# Altium schematic sheet SMPS300W-1.schdoc
size 307 x 309 mm
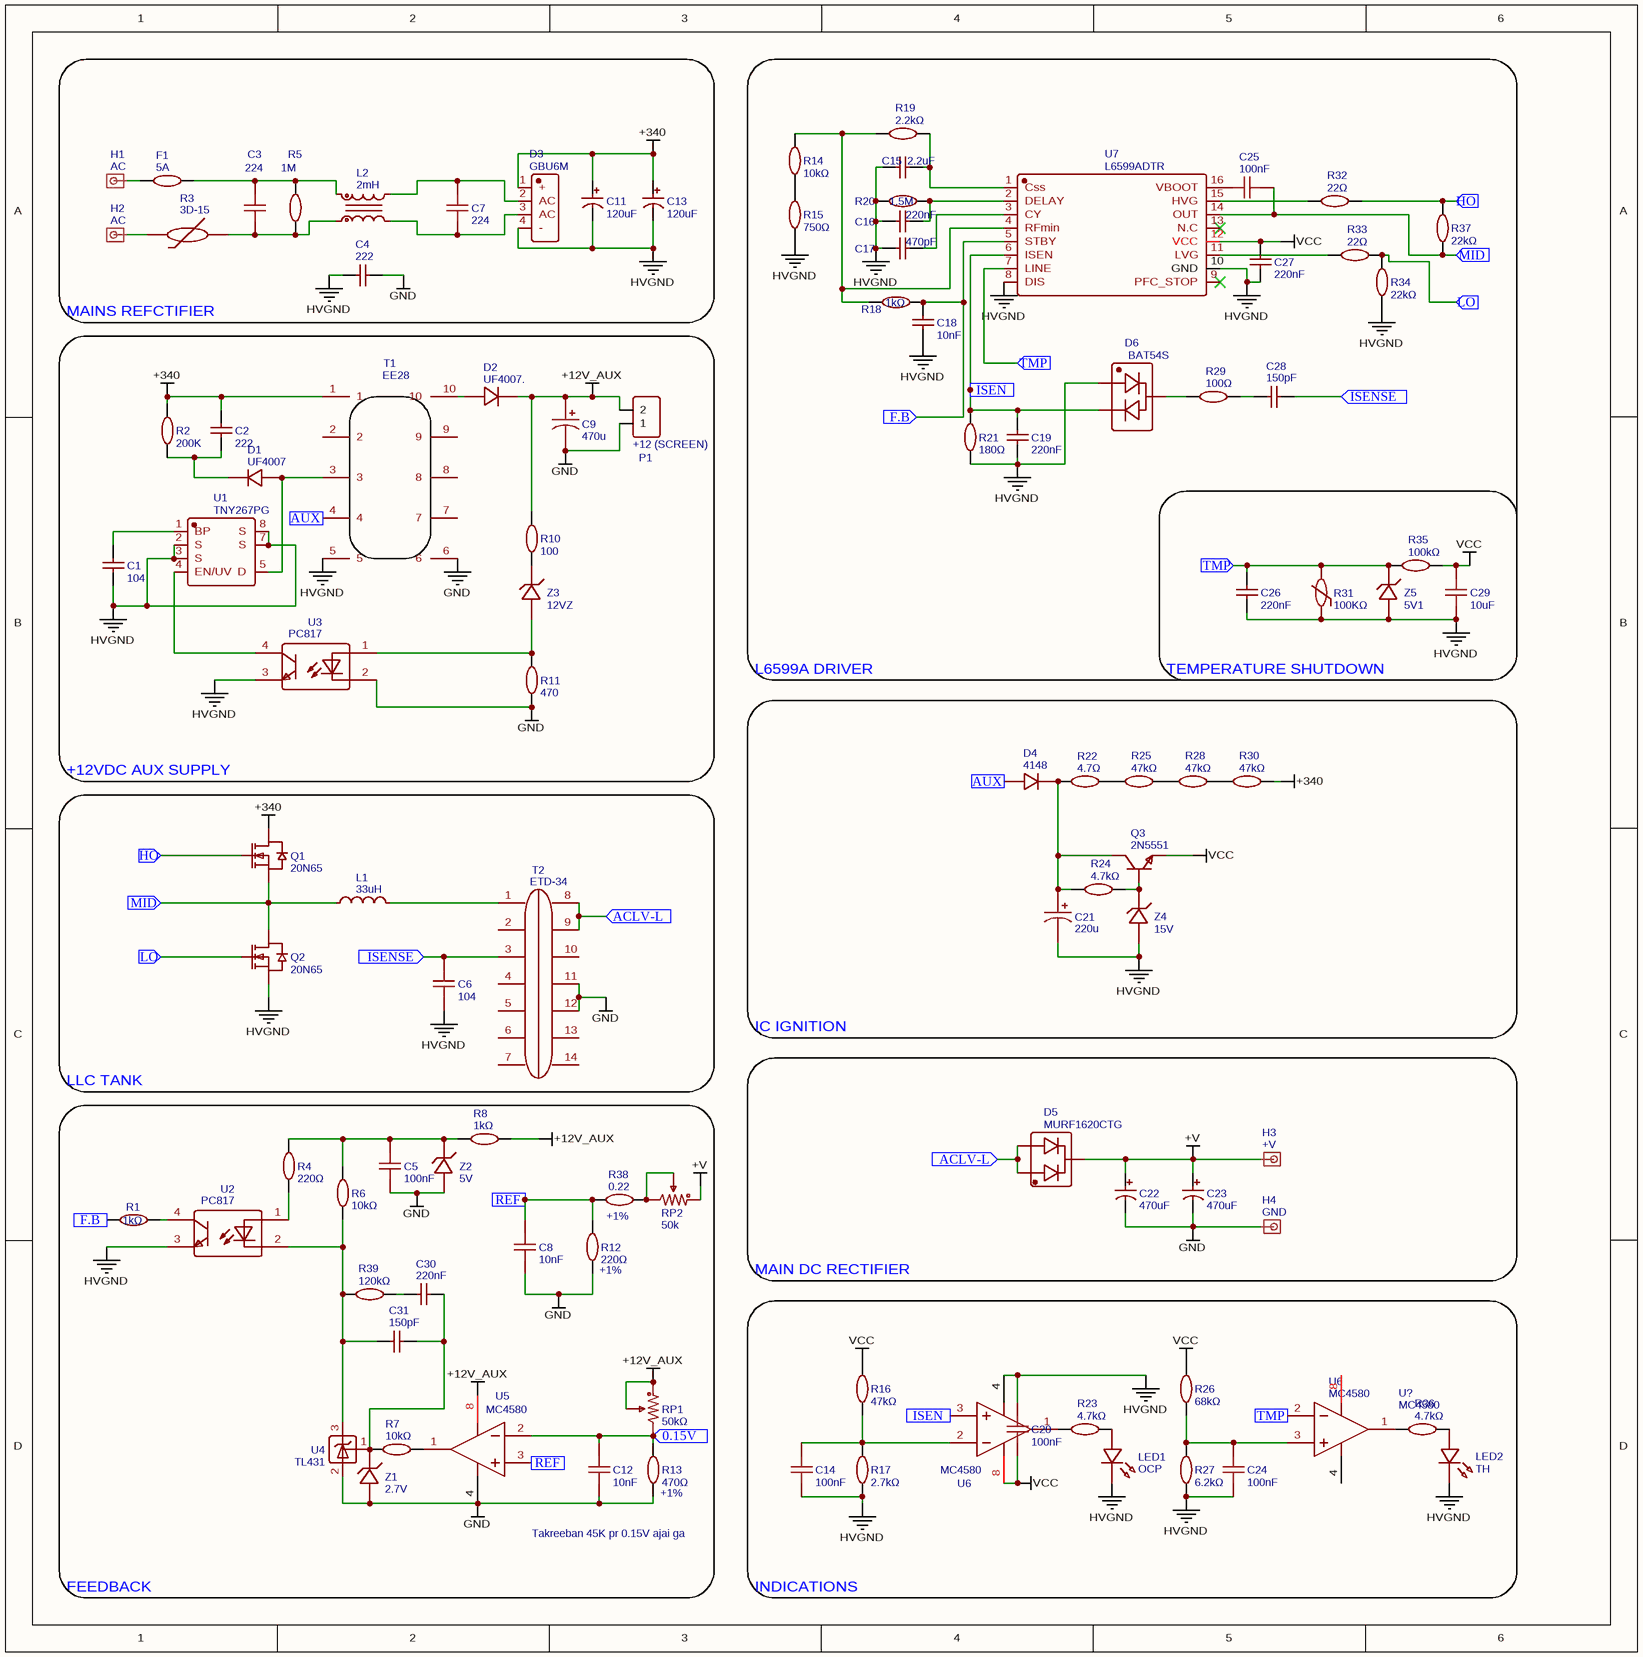
[diagram p0: SMPS300W-1.schdoc]

## Parts
(Parts that share a designator on the sheet are numbered #1, #2 ... from top to bottom, then left to right.)
C1  104  [CAP 2SILKG]
C2  222  [CAP 2SILKG]
C3  224  [CAP-TH_L18.0-W7.0-P15.00-D0.7]
C4  222  [CAP 2SILKG]
C5  100nF  [C0603]
C6  104  [CAP-TH_L17.5-W10.0-P15.00-D1.2]
C7  224  [CAP-TH_L18.0-W7.0-P15.00-D0.7]
C8  10nF  [C0603]
C9  470u  [CAP-D8.0×F3.5]
C11  120uF  [CAP-TH_BD18.0-P7.50-D1.2-FD]
C12  10nF  [C0603]
C13  120uF  [CAP-TH_BD18.0-P7.50-D1.2-FD]
C14  100nF  [C0603]
C15  2.2uF  [C0603]
C16  220nF  [C0603]
C17  470pF  [C0603]
C18  10nF  [C0603]
C19  220nF  [C0603]
C20  100nF  [C0603]
C21  220u  [C_HOR]
C22  470uF  [CAP-TH_BD16.0-P7.50-D1.2-FD]
C23  470uF  [CAP-TH_BD16.0-P7.50-D1.2-FD]
C24  100nF  [C0603]
C25  100nF  [C0603]
C26  220nF  [C0603]
C27  220nF  [C0603]
C28  150pF  [C0805]
C29  10uF  [C0805]
C30  220nF  [C0603]
C31  150pF  [C0603]
D1  UF4007  [DIODE 2SILK]
D2  UF4007.  [DO-15_BD3.1-L6.7-P10.70-D0.9-FD]
D3  GBU6M  [DIO-BG-TH_GBU]
D4  4148  [DIODE 2SILK]
D5  MURF1620CTG  [TO-220AB-3_L10.4-W4.6-P2.54-T]
D6  BAT54S  [SOT-23-3_L2.9-W1.4-P1.91-LS2.6-BR]
F1  5A  [RES 2W VERTICAL]
H1  AC  [LUGS]
H2  AC  [LUGS]
H3  +V  [LUGS]
H4  GND  [LUGS]
L1  33uH  [33UH_SMALL]
L2  2mH  [IND-TH_4P-L20.0-W12.0-P7.00]
LED1  OCP  [LED-TH_BD3.0_RED]
LED2  TH  [LED-TH_BD3.0_BLUE]
P1  +12 (SCREEN)  [CONN-TH_2P-P5.00]
Q1  20N65  [TO-220-3_L10.0-W4.5-P2.54-L]
Q2  20N65  [TO-220-3_L10.0-W4.5-P2.54-L]
Q3  2N5551  [TO-92-3_L4.8-W3.7-P2.54-L]
R1  1kΩ  [R0603]
R2  200K  [1/4W 2SILK]
R3  3D-15  [RES-TH_L17.0-W5.5-P7.50-D1.2]
R4  220Ω  [R0603]
R5  1M  [1/4W 2SILK]
R6  10kΩ  [R0603]
R7  10kΩ  [R0603]
R8  1kΩ  [1/4W 2SILK]
R10  100  [1/4W 2SILK]
R11  470  [1/4W 2SILK]
R12  220Ω  [R0603]
R13  470Ω  [R0603]
R14  10kΩ  [R0603]
R15  750Ω  [R0603]
R16  47kΩ  [R0603]
R17  2.7kΩ  [R0603]
R18  1kΩ  [R0603]
R19  2.2kΩ  [R0603]
R20  1.5M  [R0603]
R21  180Ω  [R0603]
R22  4.7Ω  [R0603]
R23  4.7kΩ  [R0603]
R24  4.7kΩ  [R0603]
R25  47kΩ  [R0805]
R26  68kΩ  [R0603]
R27  6.2kΩ  [R0603]
R28  47kΩ  [R0805]
R29  100Ω  [R0805]
R30  47kΩ  [R0805]
R31  100KΩ  [RES-TH_L7.0-W4.0-P2.50-D1.0-S2.00]
R32  22Ω  [R0603]
R33  22Ω  [R0603]
R34  22kΩ  [R0603]
R35  100kΩ  [R0603]
R36  4.7kΩ  [R0603]
R37  22kΩ  [R0603]
R38  0.22  [R0603]
R39  120kΩ  [R0603]
RP1  50kΩ  [RES-ADJ-TH_3386P]
RP2  50k  [RES-ADJ-TH_3386P]
T1  EE28  [EE28]
T2  ETD-34  [ETD-34]
U1  TNY267PG  [DIP-8B_7P-L9.6-W6.4-P2.54-LS7.6-BL-PE6]
U2  PC817  [DIP-4_L4.6-W6.5-P2.54-LS7.6-BL]
U3  PC817  [DIP-4_L4.6-W6.5-P2.54-LS7.6-BL]
U4  TL431  [TO-92-3_L4.9-W3.7-P2.54-L-A]
U5  MC4580  [SOP-8_L4.9-W3.9-P1.27-LS6.0-BL]
U6#1  MC4580  [SOP-8_L4.9-W3.9-P1.27-LS6.0-BL]
U6#2  MC4580  [SOP-8_L4.9-W3.9-P1.27-LS6.0-BL]
U7  L6599ADTR  [SOIC-16_L9.9-W3.9-P1.27-LS6.0-BL]
U?  MC4580  [SOP-8_L4.9-W3.9-P1.27-LS6.0-BL]
Z1  2.7V  [DIODE 2SILK]
Z2  5V  [DIODE 2SILK]
Z3  12VZ  [DIODE 2SILK]
Z4  15V  [DIODE 2SILK]
Z5  5V1  [DIODE 2SILK]

## Blocks framed on the sheet
MAINS REFCTIFIER: C3 C4 C7 C11 C13 D3 F1 H1 H2 L2 R3 R5
L6599A DRIVER: C15-C19 C25 C27 C28 D6 R14 R15 R18-R21 R29 R32-R34 R37 U7
+12VDC AUX SUPPLY: C1 C2 C9 D1 D2 P1 R2 R10 R11 T1 U1 U3 Z3
TEMPERATURE SHUTDOWN: C26 C29 R31 R35 Z5
IC IGNITION: C21 D4 Q3 R22 R24 R25 R28 R30 Z4
MAIN DC RECTIFIER: C22 C23 D5 H3 H4
INDICATIONS: C14 C20 C24 LED1 LED2 R16 R17 R23 R26 R27 R36 U6#1 U6#2 U?

## Ports
0.15V (in), ACLV-L (in), AUX (in), F.B (in), HO (in), ISEN (in), ISENSE (in), LO (in), MID (in), REF (in), TMP (in)

## Nets
+12V_AUX: C9.1 D2.2(K) P1.2 R8.1 R10.1 RP1.1 RP1.2 U5.8(V+)
+340: C2.1 C11.1 C13.1 D3.1(+) Q1.2(D) R2.1 R30.2 T1.1
+V: C22.1 C23.1 D5.2 H3.1 RP2.1
GND: C4.2 C5.1 C8.1 C9.2 C12.1 C22.2 C23.2 H4.1 P1.1 R11.2 R12.1 R13.1 T1.6 T2.11 T2.12 U3.2(CAT) U4.2(A) U5.4(V-) Z1.1(A) Z2.1(A)
HVGND: C1.2 C4.1 C6.2 C11.2 C13.2 C14.1 C15.1 C16.1 C17.1 C18.1 C19.1 C20.2 C21.2 C24.1 C26.1 C27.1 C29.1 D3.4(-) D6.1 LED1.2 LED2.2 Q2.3(S) R15.1 R17.1 R20.1 R21.1 R27.1 R31.1 R34.1 T1.5 U1.2(S) U1.3(S) U1.7(S) U1.8(S) U2.3(EM) U3.3(EM) U6#1.4(V-) U7.8(DIS) U7.10(GND) Z4.1(A) Z5.1(A)
VCC: C20.1 C27.2 C29.2 Q3.1(E) R16.2 R26.2 R35.2 U6#1.8(V+) U7.12(VCC)
0.15V: C12.2 R13.2 RP1.3 U5.2(IN_A-) ; port 0.15V
ACLV-L: D5.1 D5.3 T2.8 T2.9 ; port ACLV-L
AUX: D4.1(A) T1.4 ; port AUX
F.B: C18.2 R1.1 R18.2 U7.5(STBY) ; port F.B
HO: Q1.1(G) R32.2 R37.2 ; port HO
ISEN: C19.2 D6.2 R21.2 U6#1.3(IN_A+) U7.6(ISEN) ; port ISEN
ISENSE: C6.1 C28.2 T2.3 ; port ISENSE
LO: Q2.1(G) R33.2 R34.2 ; port LO
MID: C25.2 L1.1 Q1.3(S) Q2.2(D) R37.1 U7.14(OUT) ; port MID
REF: C8.2 R12.2 R38.2 U5.3(IN_A+) ; port REF
TMP: C26.2 R31.2 R35.1 U7.7(LINE) U?.2(IN_A-) Z5.2(K) ; port TMP
NetC1_1: C1.1 U1.1(BP)
NetC2_2: C2.2 D1.2(K) R2.2
NetC3_1: C3.1 L2.1 R3.2 R5.1
NetC3_2: C3.2 F1.1 L2.4 R5.2
NetC5_2: C5.2 R4.2 R6.2 R8.2 Z2.2(K)
NetC7_1: C7.1 D3.3(AC) L2.2
NetC7_2: C7.2 D3.2(AC) L2.3
NetC14_2: C14.2 R16.1 R17.2 U6#1.2(IN_A-)
NetC15_2: C15.2 R19.2 U7.1(Css)
NetC16_2: C16.2 R20.2 U7.2(DELAY)
NetC17_2: C17.2 U7.3(CY)
NetC21_1: C21.1 D4.2(K) Q3.3(C) R22.1 R24.1
NetC24_2: C24.2 R26.1 R27.2 U?.3(IN_A+)
NetC25_1: C25.1 U7.16(VBOOT)
NetC28_1: C28.1 R29.2
NetC30_1: C30.1 R39.1
NetC30_2: C30.2 C31.2 R7.2 U4.1(R) Z1.2(K)
NetC31_1: C31.1 R6.1 R39.2 U2.2(CAT) U4.3(K)
NetD1_1: D1.1(A) T1.3 U1.5(D)
NetD2_1: D2.1(A) T1.10
NetD6_3: D6.3 R29.1
NetF1_2: F1.2 H1.1
NetH2_1: H2.1 R3.1
NetL1_2: L1.2 T2.1
NetLED1_1: LED1.1 R23.2
NetLED2_1: LED2.1 R36.2
NetQ3_2: Q3.2(B) R24.2 Z4.2(K)
NetR1_2: R1.2 U2.4(COL)
NetR4_1: R4.1 U2.1(AN)
NetR7_1: R7.1 U5.1(OUT_A)
NetR10_2: R10.2 Z3.2(K)
NetR11_1: R11.1 U3.1(AN) Z3.1(A)
NetR14_1: R14.1 R15.2
NetR14_2: R14.2 R18.1 R19.1 U7.4(RFmin)
NetR22_2: R22.2 R25.1
NetR23_1: R23.1 U6#1.1(OUT_A)
NetR25_2: R25.2 R28.1
NetR28_2: R28.2 R30.1
NetR32_1: R32.1 U7.15(HVG)
NetR33_1: R33.1 U7.11(LVG)
NetR36_1: R36.1 U?.1(OUT_A)
NetR38_1: R38.1 RP2.2 RP2.3
NetU1_4: U1.4(EN/UV) U3.4(COL)

Not connected (* = marked no-connect by the designer): T1 2 7 8 9; T2 2 4 5 6 7 10 13 14; U7 9(PFC_STOP)* 13(N.C)*; U? 4(V-) 8(V+)

## Notes on the sheet
- LLC TANK
- (near R12) +1%
- +1%
- Takreeban 45K pr 0.15V ajai ga
- (near R13) +1%
- FEEDBACK

## Library data of the parts
C1 = 104: Contributor: shaikhabdulmobeen; spicePre: C; spiceSymbolName: 104(GRY)
C2 C4 = 222: Contributor: shaikhabdulmobeen; spicePre: C; spiceSymbolName: 104(GRY)
C3 C7 = 224: BOM_Manufacturer: 东通电子; BOM_Manufacturer Part: MKP62-275VAC/334; nameAlias: Capacitance; Contributor: LCSC; BOM_Supplier: LCSC; BOM_Supplier Part: C2913191; BOM_JLCPCB Part Class: Extended Part; spicePre: C; spiceSymbolName: MKP62-275VAC/334
C5 C14 C20 C24 C25 = 100nF: BOM_Manufacturer: YAGEO(国巨); BOM_Manufacturer Part: CC0603KRX7R9BB104; nameAlias: Capacitance; BOM_Supplier: LCSC; BOM_Supplier Part: C14663; BOM_JLCPCB Part Class: Basic Part; spicePre: C; spiceSymbolName: CC0603KRX7R9BB104
C6 = 104: BOM_Manufacturer: faratronic(厦门法拉); BOM_Manufacturer Part: C822J104J60C000; nameAlias: Capacitance; Contributor: LCSC; BOM_Supplier: LCSC; BOM_Supplier Part: C280299; BOM_JLCPCB Part Class: Extended Part; spicePre: C; spiceSymbolName: C822J104J60C000
C8 C12 = 10nF: BOM_Manufacturer: YAGEO(国巨); BOM_Manufacturer Part: CC0603KRX7R9BB104; nameAlias: Capacitance; BOM_Supplier: LCSC; BOM_Supplier Part: C14663; BOM_JLCPCB Part Class: Basic Part; spicePre: C; spiceSymbolName: CC0603KRX7R9BB104
C9 = 470u: nameAlias: Value(F); Contributor: LCEDA_Lib; spicePre: C; spiceSymbolName: CE_TH_D8.0×F3.5_US
C11 C13 = 120uF: BOM_Manufacturer: CX(承兴); BOM_Manufacturer Part: KM127M400L30RR0VH2FP0; nameAlias: Capacitance; BOM_Supplier: LCSC; BOM_Supplier Part: C46881; BOM_JLCPCB Part Class: Extended Part; spicePre: C; spiceSymbolName: 120uF 400V 18*30
C15 = 2.2uF: BOM_Manufacturer Part: CL10A225KO8NNNC; BOM_Manufacturer: SAMSUNG(三星); nameAlias: Capacitance; BOM_Supplier: LCSC; BOM_Supplier Part: C23630; BOM_JLCPCB Part Class: Basic Part; spicePre: C; spiceSymbolName: CL10A225KO8NNNC
C16 C19 C26 C27 = 220nF: BOM_Manufacturer Part: CL10B224KA8NNNC; BOM_Manufacturer: SAMSUNG(三星); nameAlias: Capacitance; BOM_Supplier: LCSC; BOM_Supplier Part: C21120; BOM_JLCPCB Part Class: Basic Part; spicePre: C; spiceSymbolName: CL10B224KA8NNNC
C17 = 470pF: BOM_Manufacturer: FH(风华); BOM_Manufacturer Part: 0603B471K500NT; nameAlias: Capacitance; BOM_Supplier: LCSC; BOM_Supplier Part: C1620; BOM_JLCPCB Part Class: Basic Part; spicePre: C; spiceSymbolName: 0603B471K500NT
C18 = 10nF: BOM_Manufacturer Part: CL10B333KB8NNNC; BOM_Manufacturer: SAMSUNG(三星); nameAlias: Capacitance; BOM_Supplier: LCSC; BOM_Supplier Part: C21117; BOM_JLCPCB Part Class: Basic Part; spicePre: C; spiceSymbolName: CL10B333KB8NNNC
C21 = 220u: Contributor: shaikhabdulmobeen; spicePre: C; spiceSymbolName: cap horizontal
C22 C23 = 470uF: BOM_Manufacturer: CX(承兴); BOM_Manufacturer Part: KM477M100K25RR0VH2FP0; nameAlias: Capacitance; BOM_Supplier: LCSC; BOM_Supplier Part: C72551; BOM_JLCPCB Part Class: Extended Part; spicePre: C; spiceSymbolName: 470uF 100V 16*25
C28 = 150pF: BOM_Manufacturer: FH(风华); BOM_Manufacturer Part: 0805B151K500NT; nameAlias: Capacitance; BOM_Supplier: LCSC; BOM_Supplier Part: C1716; BOM_JLCPCB Part Class: Basic Part; spicePre: C; spiceSymbolName: 0805B151K500NT
C29 = 10uF: BOM_Manufacturer: muRata(村田); BOM_Manufacturer Part: GRM21BR61H106KE43L; nameAlias: Capacitance; Contributor: LCSC; BOM_Supplier: LCSC; BOM_Supplier Part: C440198; BOM_JLCPCB Part Class: Basic Part; spicePre: C; spiceSymbolName: GRM21BR61H106KE43L
C30 = 220nF: BOM_Manufacturer: FH(风华); BOM_Manufacturer Part: 0603B103K500NT; nameAlias: Capacitance; BOM_Supplier: LCSC; BOM_Supplier Part: C57112; BOM_JLCPCB Part Class: Basic Part; spicePre: C; spiceSymbolName: 0603B103K500NT
C31 = 150pF: BOM_Manufacturer: FH(风华); BOM_Manufacturer Part: 0603B151K500NT; nameAlias: Capacitance; BOM_Supplier: LCSC; BOM_Supplier Part: C1594; BOM_JLCPCB Part Class: Basic Part; spicePre: C; spiceSymbolName: 0603B151K500NT
D1 = UF4007: Contributor: shaikhabdulmobeen; spicePre: D; spiceSymbolName: 4148
D2 = UF4007.: BOM_Manufacturer: GD(固锝); BOM_Manufacturer Part: HER205; Contributor: LCSC; BOM_Supplier: LCSC; BOM_Supplier Part: C232180; BOM_JLCPCB Part Class: Extended Part; spicePre: D; spiceSymbolName: HER205_C232180
D3 = GBU6M: BOM_Manufacturer: PANJIT(强茂); BOM_Manufacturer Part: GBU6M_B0_10001; Contributor: LCSC; BOM_Supplier: LCSC; BOM_Supplier Part: C393434; BOM_JLCPCB Part Class: Extended Part; spicePre: D; spiceSymbolName: GBU6M_B0_10001
D4 = 4148: Contributor: shaikhabdulmobeen; spicePre: D; spiceSymbolName: 4148
D5 = MURF1620CTG: BOM_Manufacturer: Suzhou Good-Ark Elec; BOM_Manufacturer Part: MBRF20150CT; Contributor: LCSC; BOM_Supplier: LCSC; BOM_Supplier Part: C174019; spicePre: D; spiceSymbolName: MBRF20150CT_C174019
D6 = BAT54S: BOM_Manufacturer: CBI(创基); BOM_Manufacturer Part: BAT54S KL4; Contributor: LCSC; BOM_Supplier: LCSC; BOM_Supplier Part: C2828465; BOM_JLCPCB Part Class: Extended Part; spicePre: D; spiceSymbolName: BAT54S KL4_C2828465
F1 = 5A: BOM_Manufacturer: UniOhm; BOM_Manufacturer Part: MFR03SF5601A10; nameAlias: Resistance (Ohms); BOM_Supplier: LCSC; BOM_Supplier Part: C83337; spicePre: R; spiceSymbolName: MFR03SF5601A10
H1 H2 = AC: Contributor: shaikhabdulmobeen; spicePre: H; spiceSymbolName: LUGS
H3 = +V: Contributor: shaikhabdulmobeen; spicePre: H; spiceSymbolName: LUGS
H4 = GND: Contributor: shaikhabdulmobeen; spicePre: H; spiceSymbolName: LUGS
L1 = 33uH: Contributor: shaikhabdulmobeen; Inductance: 15uH; BOM_Supplier: LCSC; spicePre: L; spiceSymbolName: 33uH_Small
L2 = 2mH: BOM_Manufacturer: PROD(谱罗德); BOM_Manufacturer Part: PDMCAT16128-202ML; Contributor: LCSC; BOM_Supplier: LCSC; BOM_Supplier Part: C2829012; BOM_JLCPCB Part Class: Extended Part; spicePre: L; spiceSymbolName: PDMCAT16128-202ML
LED1 = OCP: BOM_Manufacturer: EVERLIGHT(台湾亿光); BOM_Manufacturer Part: 204-10SDRD/S530-A3-L; Contributor: LCEDA_Lib; BOM_Supplier Part: C84774; BOM_Supplier: LCSC; spicePre: L; spiceSymbolName: LED-TH-3mm_R
LED2 = TH: BOM_Manufacturer: EVERLIGHT(台湾亿光); BOM_Manufacturer Part: 204-10SUBC/S400-A4; Contributor: LCEDA_Lib; BOM_Supplier Part: C86881; BOM_Supplier: LCSC; spicePre: L; spiceSymbolName: LED-TH-3mm_B
P1 = +12 (SCREEN): Contributor: LCEDA_Lib; BOM_Supplier: LCSC; spicePre: P; spiceSymbolName: CONN-TH_2P-P5.00
Q1 Q2 = 20N65: BOM_Manufacturer: Infineon(英飞凌); BOM_Manufacturer Part: IRFZ44VZPBF; Contributor: LCSC; BOM_Supplier: LCSC; BOM_Supplier Part: C538077; BOM_JLCPCB Part Class: Extended Part; spicePre: Q; spiceSymbolName: IRFZ44VZPBF
Q3 = 2N5551: BOM_Manufacturer: KEC; BOM_Manufacturer Part: 2N5551-AT/P; Contributor: LCSC; BOM_Supplier: LCSC; BOM_Supplier Part: C220530; BOM_JLCPCB Part Class: Extended Part; spicePre: Q; spiceSymbolName: 2N5551-AT/P
R1 R18 = 1kΩ: BOM_Manufacturer: UNI-ROYAL(厚声); BOM_Manufacturer Part: 0603WAF1001T5E; nameAlias: Resistance; Resistance (Ohms): 1K; BOM_Supplier: LCSC; BOM_Supplier Part: C21190; BOM_JLCPCB Part Class: Basic Part; spicePre: R; spiceSymbolName: 0603WAF1001T5E
R2 = 200K: Contributor: shaikhabdulmobeen; spicePre: R; spiceSymbolName: 1K
R3 = 3D-15: BOM_Manufacturer: RUILON(瑞隆源); BOM_Manufacturer Part: NTC 3D-15; nameAlias: Value; Contributor: LCSC; BOM_Supplier: LCSC; BOM_Supplier Part: C207388; BOM_JLCPCB Part Class: Extended Part; spicePre: R; spiceSymbolName: NTC 3D-15
R4 R12 = 220Ω: BOM_Manufacturer: UNI-ROYAL(厚声); BOM_Manufacturer Part: 0603WAF3001T5E; nameAlias: Resistance; Resistance (Ohms): 3K; BOM_Supplier: LCSC; BOM_Supplier Part: C4211; BOM_JLCPCB Part Class: Basic Part; spicePre: R; spiceSymbolName: 0603WAF3001T5E
R5 = 1M: Contributor: shaikhabdulmobeen; spicePre: R; spiceSymbolName: 1K
R6 R7 R14 = 10kΩ: BOM_Manufacturer: UNI-ROYAL(厚声); BOM_Manufacturer Part: 0603WAF1002T5E; nameAlias: Resistance; Resistance (Ohms): 10K; BOM_Supplier: LCSC; BOM_Supplier Part: C25804; BOM_JLCPCB Part Class: Basic Part; spicePre: R; spiceSymbolName: 0603WAF1002T5E
R8 = 1kΩ: Contributor: shaikhabdulmobeen; spicePre: R; spiceSymbolName: 1K
R10 = 100: Contributor: shaikhabdulmobeen; spicePre: R; spiceSymbolName: 1K
R11 = 470: Contributor: shaikhabdulmobeen; spicePre: R; spiceSymbolName: 1K
R13 = 470Ω: BOM_Manufacturer: UNI-ROYAL(厚声); BOM_Manufacturer Part: 0603WAF1002T5E; nameAlias: Resistance; Resistance (Ohms): 10K; BOM_Supplier: LCSC; BOM_Supplier Part: C25804; BOM_JLCPCB Part Class: Basic Part; spicePre: R; spiceSymbolName: 0603WAF1002T5E
R15 = 750Ω: BOM_Manufacturer: UNI-ROYAL(厚声); BOM_Manufacturer Part: 0603WAF7500T5E; nameAlias: Resistance; Resistance (Ohms): 750; BOM_Supplier: LCSC; BOM_Supplier Part: C23241; BOM_JLCPCB Part Class: Basic Part; spicePre: R; spiceSymbolName: 0603WAF7500T5E
R16 = 47kΩ: BOM_Manufacturer: UNI-ROYAL(厚声); BOM_Manufacturer Part: 0603WAF4702T5E; nameAlias: Resistance; Resistance (Ohms): 47K; BOM_Supplier: LCSC; BOM_Supplier Part: C25819; BOM_JLCPCB Part Class: Basic Part; spicePre: R; spiceSymbolName: 0603WAF4702T5E
R17 = 2.7kΩ: BOM_Manufacturer: UNI-ROYAL(厚声); BOM_Manufacturer Part: 0603WAF2701T5E; nameAlias: Resistance; Resistance (Ohms): 2.7K; BOM_Supplier: LCSC; BOM_Supplier Part: C13167; BOM_JLCPCB Part Class: Basic Part; spicePre: R; spiceSymbolName: 0603WAF2701T5E
R19 = 2.2kΩ: BOM_Manufacturer: UNI-ROYAL(厚声); BOM_Manufacturer Part: 0603WAF2201T5E; nameAlias: Resistance; Resistance (Ohms): 2.2K; BOM_Supplier: LCSC; BOM_Supplier Part: C4190; BOM_JLCPCB Part Class: Basic Part; spicePre: R; spiceSymbolName: 0603WAF2201T5E
R20 = 1.5M: BOM_Manufacturer: UNI-ROYAL(厚声); BOM_Manufacturer Part: 0603WAF1504T5E; nameAlias: Resistance; BOM_Supplier: LCSC; BOM_Supplier Part: C4172; Resistance (Ohms): 1.5M; BOM_JLCPCB Part Class: Basic Part; spicePre: R; spiceSymbolName: 0603WAF1504T5E
R21 = 180Ω: BOM_Manufacturer: UNI-ROYAL(厚声); BOM_Manufacturer Part: 0603WAF1800T5E; nameAlias: Resistance; Resistance (Ohms): 180; BOM_Supplier: LCSC; BOM_Supplier Part: C22828; BOM_JLCPCB Part Class: Basic Part; spicePre: R; spiceSymbolName: 0603WAF1800T5E
R22 = 4.7Ω: BOM_Manufacturer: UNI-ROYAL(厚声); BOM_Manufacturer Part: 0603WAF470KT5E; nameAlias: Resistance; Resistance (Ohms): 4.7; BOM_Supplier: LCSC; BOM_Supplier Part: C23164; BOM_JLCPCB Part Class: Basic Part; spicePre: R; spiceSymbolName: 0603WAF470KT5E
R23 R24 R36 = 4.7kΩ: BOM_Manufacturer: UNI-ROYAL(厚声); BOM_Manufacturer Part: 0603WAF4701T5E; nameAlias: Resistance; Resistance (Ohms): 4.7K; BOM_Supplier: LCSC; BOM_Supplier Part: C23162; BOM_JLCPCB Part Class: Basic Part; spicePre: R; spiceSymbolName: 0603WAF4701T5E
R25 R28 R30 = 47kΩ: BOM_Manufacturer: UNI-ROYAL(厚声); BOM_Manufacturer Part: 0805W8F4702T5E; nameAlias: Resistance; Resistance (Ohms): 47K; BOM_Supplier: LCSC; BOM_Supplier Part: C17713; BOM_JLCPCB Part Class: Basic Part; spicePre: R; spiceSymbolName: 0805W8F4702T5E
R26 = 68kΩ: BOM_Manufacturer: UNI-ROYAL(厚声); BOM_Manufacturer Part: 0603WAF6802T5E; nameAlias: Resistance; Resistance (Ohms): 68K; BOM_Supplier: LCSC; BOM_Supplier Part: C23231; BOM_JLCPCB Part Class: Basic Part; spicePre: R; spiceSymbolName: 0603WAF6802T5E
R27 = 6.2kΩ: BOM_Manufacturer: UNI-ROYAL(厚声); BOM_Manufacturer Part: 0603WAF6201T5E; nameAlias: Resistance; Resistance (Ohms): 6.2K; BOM_Supplier: LCSC; BOM_Supplier Part: C4260; BOM_JLCPCB Part Class: Basic Part; spicePre: R; spiceSymbolName: 0603WAF6201T5E
R29 = 100Ω: BOM_Manufacturer: UNI-ROYAL(厚声); BOM_Manufacturer Part: 0805W8F1000T5E; nameAlias: Resistance; Resistance (Ohms): 100; BOM_Supplier: LCSC; BOM_Supplier Part: C17408; BOM_JLCPCB Part Class: Basic Part; spicePre: R; spiceSymbolName: 0805W8F1000T5E
R31 = 100KΩ: BOM_Manufacturer: 时恒; BOM_Manufacturer Part: MF11 104J; nameAlias: Value; Contributor: LCSC; BOM_Supplier: LCSC; BOM_Supplier Part: C123366; BOM_JLCPCB Part Class: Extended Part; spicePre: R; spiceSymbolName: 100KΩ ±5%
R32 R33 = 22Ω: BOM_Manufacturer: UNI-ROYAL(厚声); BOM_Manufacturer Part: 0603WAF220JT5E; nameAlias: Resistance; Resistance (Ohms): 22; BOM_Supplier: LCSC; BOM_Supplier Part: C23345; BOM_JLCPCB Part Class: Basic Part; spicePre: R; spiceSymbolName: 0603WAF220JT5E
R34 R37 = 22kΩ: BOM_Manufacturer: UNI-ROYAL(厚声); BOM_Manufacturer Part: 0603WAF2202T5E; nameAlias: Resistance; Resistance (Ohms): 22K; BOM_Supplier: LCSC; BOM_Supplier Part: C31850; BOM_JLCPCB Part Class: Basic Part; spicePre: R; spiceSymbolName: 0603WAF2202T5E
R35 = 100kΩ: BOM_Manufacturer: UNI-ROYAL(厚声); BOM_Manufacturer Part: 0603WAF1003T5E; nameAlias: Resistance; Resistance (Ohms): 100K; BOM_Supplier: LCSC; BOM_Supplier Part: C25803; BOM_JLCPCB Part Class: Basic Part; spicePre: R; spiceSymbolName: 0603WAF1003T5E
R38 = 0.22: BOM_Manufacturer: UNI-ROYAL(厚声); BOM_Manufacturer Part: 0603WAF3001T5E; nameAlias: Resistance; Resistance (Ohms): 3K; BOM_Supplier: LCSC; BOM_Supplier Part: C4211; BOM_JLCPCB Part Class: Basic Part; spicePre: R; spiceSymbolName: 0603WAF3001T5E
R39 = 120kΩ: BOM_Manufacturer: UNI-ROYAL(厚声); BOM_Manufacturer Part: 0603WAF1002T5E; nameAlias: Resistance; Resistance (Ohms): 10K; BOM_Supplier: LCSC; BOM_Supplier Part: C25804; BOM_JLCPCB Part Class: Basic Part; spicePre: R; spiceSymbolName: 0603WAF1002T5E
RP1 = 50kΩ: nameAlias: Value; Contributor: LCEDA_Lib; BOM_value(Ω): 10K; BOM_Supplier: LCSC; spicePre: R; spiceSymbolName: R_3386P_US
RP2 = 50k: nameAlias: Value; Contributor: LCEDA_Lib; BOM_value(Ω): 10K; BOM_Supplier: LCSC; spicePre: R; spiceSymbolName: R_3386P_US
T1 = EE28: Contributor: shaikhabdulmobeen; spicePre: T; spiceSymbolName: EE28
T2 = ETD-34: Contributor: shaikhabdulmobeen; spicePre: T; spiceSymbolName: ETD-34
U1 = TNY267PG: BOM_Manufacturer: Power Integrations(帕沃英蒂格盛); Contributor: lcsc; BOM_Supplier: LCSC; BOM_Supplier Part: C568048; BOM_Manufacturer Part: TNY267PG; link: https://atta.szlcsc.comnull; spicePre: U; spiceSymbolName: TNY267PG
U2 U3 = PC817: BOM_Manufacturer: UTC(友顺); BOM_Manufacturer Part: UPC817CG-D04-T; Contributor: LCSC; BOM_Supplier: LCSC; BOM_Supplier Part: C127009; BOM_JLCPCB Part Class: Extended Part; spicePre: U; spiceSymbolName: UPC817CG-D04-T
U4 = TL431: BOM_Manufacturer: TI(德州仪器); BOM_Manufacturer Part: TL431CLPM; Contributor: LCSC; BOM_Supplier: LCSC; BOM_Supplier Part: C1575335; link: https://atta.szlcsc.comnull; BOM_JLCPCB Part Class: Extended Part; spicePre: U; spiceSymbolName: TL431CLPMTL431CLPM
U5 U6#1 U6#2 U? = MC4580: BOM_Manufacturer: UTC(友顺); BOM_Manufacturer Part: MC4580G-S08-R; subpart_no: 1; Contributor: shaikhabdulmobeen; BOM_Supplier: LCSC; BOM_Supplier Part: C73206; BOM_JLCPCB Part Class: Extended Part; spicePre: U; spiceSymbolName: MC4580
U7 = L6599ADTR: BOM_Manufacturer: ST(意法半导体); Contributor: LCSC; BOM_Supplier: LCSC; BOM_Supplier Part: C61742; BOM_Manufacturer Part: L6599ADTR; BOM_JLCPCB Part Class: Extended Part; spicePre: U; spiceSymbolName: L6599ADTR
Z1 = 2.7V: Contributor: shaikhabdulmobeen; spicePre: Z; spiceSymbolName: 15VZ
Z2 = 5V: Contributor: shaikhabdulmobeen; spicePre: Z; spiceSymbolName: 15VZ
Z3 = 12VZ: Contributor: shaikhabdulmobeen; spicePre: Z; spiceSymbolName: 15VZ
Z4 = 15V: Contributor: shaikhabdulmobeen; spicePre: Z; spiceSymbolName: 15VZ
Z5 = 5V1: Contributor: shaikhabdulmobeen; spicePre: Z; spiceSymbolName: 15VZ